# Altium project EITWatch.PrjPcb
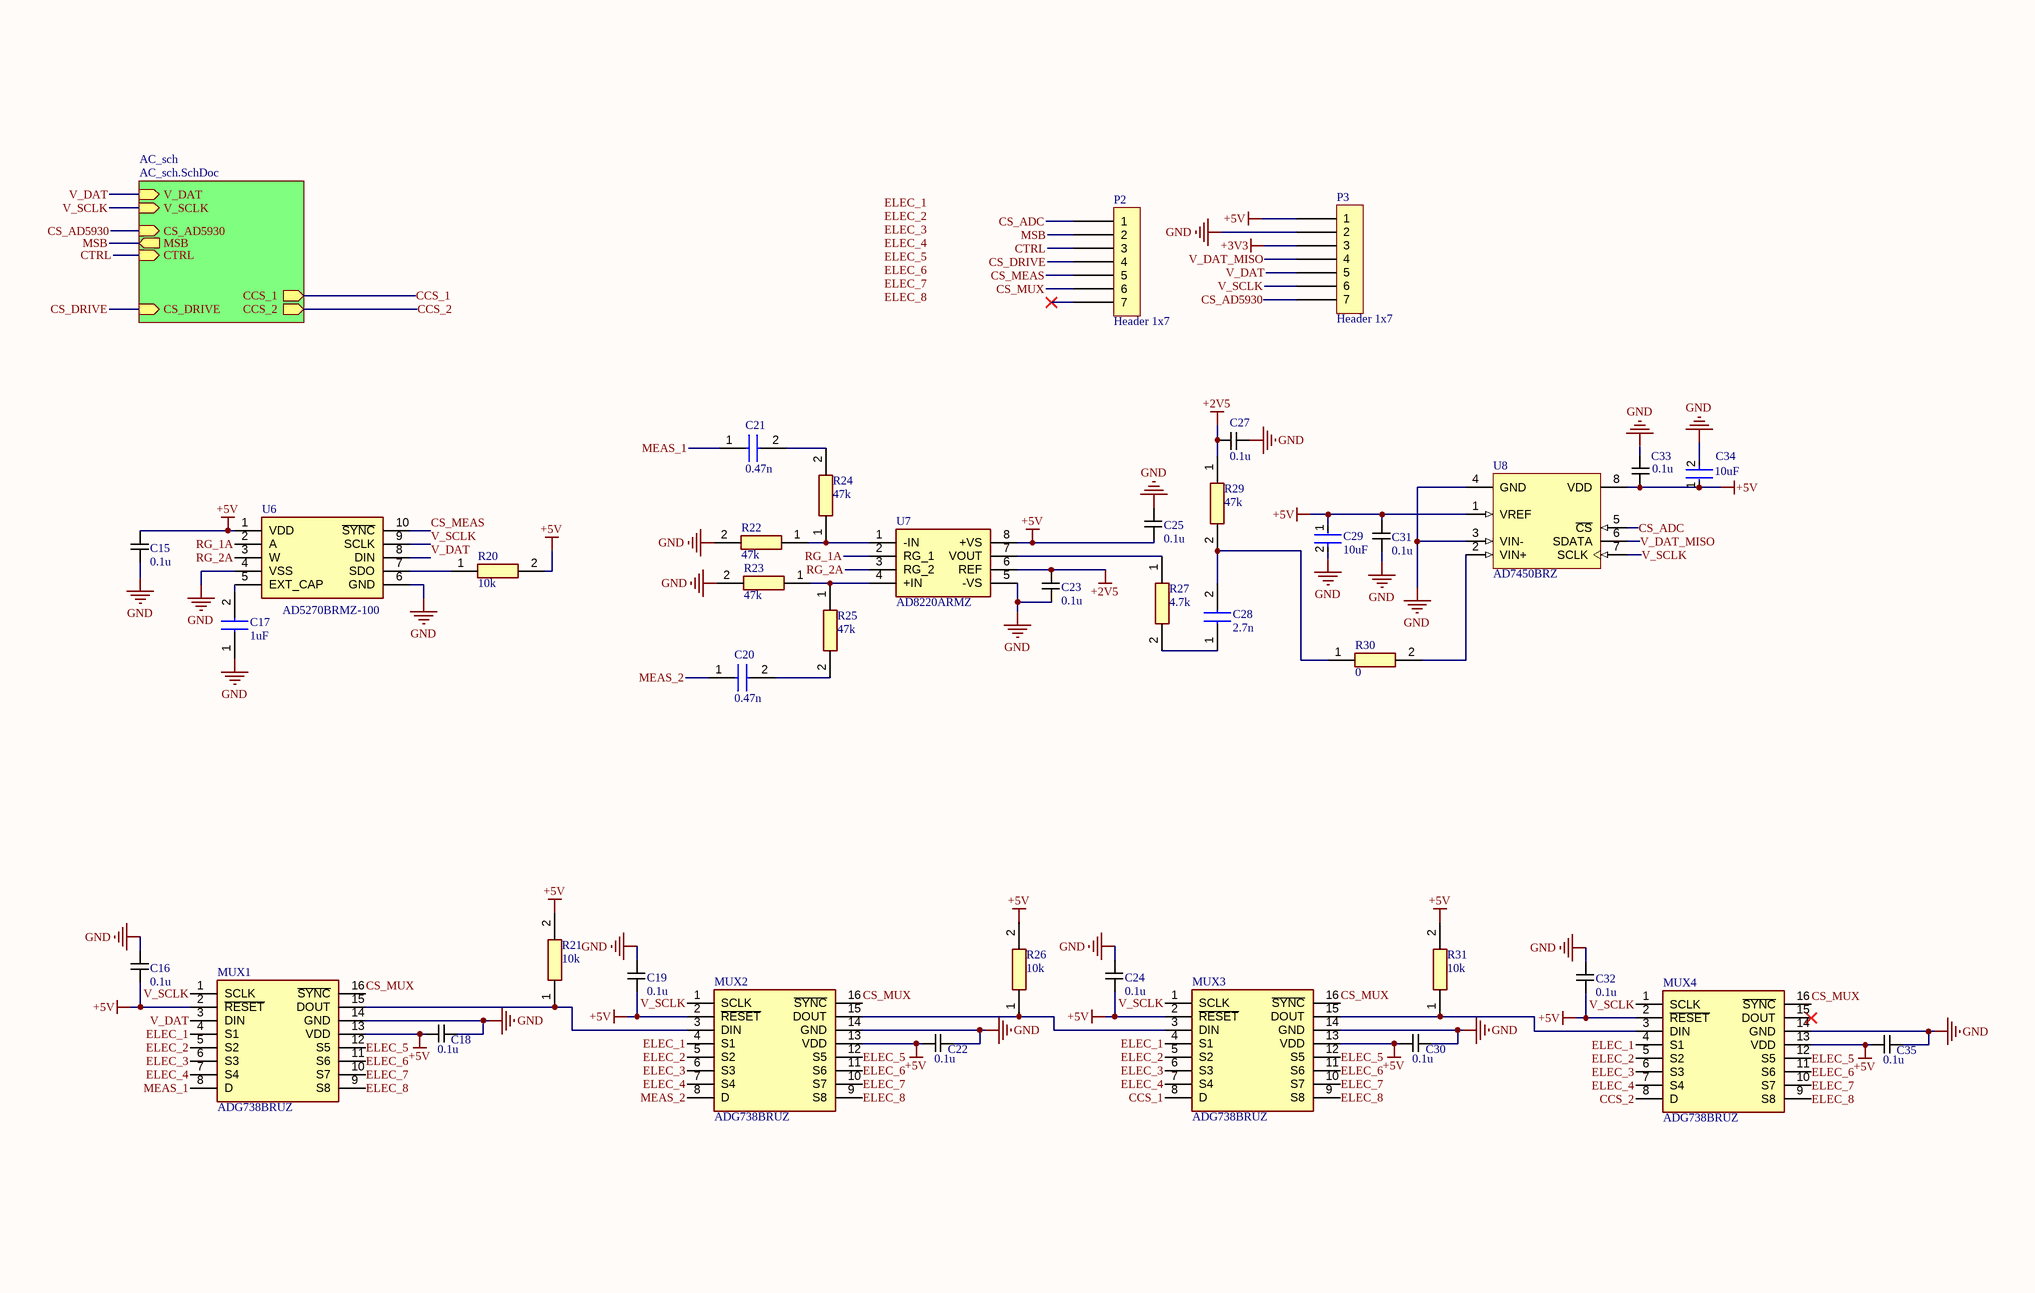
[diagram p0: main.SchDoc]
2 sheets, 77 parts. Net scope: hierarchical (ports join the sheet entries above them; power ports are global).
Board file: main.PcbDoc
Sheets:
  main.SchDoc
    AC_sch = AC_sch.SchDoc

## Sheet main.SchDoc
size B; Organization: ORGANIZATION; Address1: ADDRESS 1; Address2: ADDRESS 2; Address3: ADDRESS 3; Address4: ADDRESS 4; Revision: -; SheetNumber: 1; SheetTotal: 2; ENG_APP_DATE: --/--/--; DSN_APP_DATE: --/--/--; CHK_APP_DATE: --/--/--

### Parts
C15  0.1u  [CAPC1005X55N]
C16  0.1u  [CAPC1005X55N]
C17  1uF  [CAPC1005X55N]
C18  0.1u  [CAPC1005X55N]
C19  0.1u  [CAPC1005X55N]
C20  0.47n  [CAPC1005X70N]
C21  0.47n  [CAPC1005X70N]
C22  0.1u  [CAPC1005X55N]
C23  0.1u  [CAPC1005X55N]
C24  0.1u  [CAPC1005X55N]
C25  0.1u  [CAPC1005X55N]
C27  0.1u  [CAPC1005X55N]
C28  2.7n  [CAPC1608X90N]
C29  10uF  [FP-0402-L_1_0_1-W_0_5_0_1-MFG]
C30  0.1u  [CAPC1005X55N]
C31  0.1u  [CAPC1005X55N]
C32  0.1u  [CAPC1005X55N]
C33  0.1u  [CAPC1005X55N]
C34  10uF  [FP-0402-L_1_0_1-W_0_5_0_1-MFG]
C35  0.1u  [CAPC1005X55N]
MUX1  ADG738BRUZ  [SOP65P640X120-16N]
MUX2  ADG738BRUZ  [SOP65P640X120-16N]
MUX3  ADG738BRUZ  [SOP65P640X120-16N]
MUX4  ADG738BRUZ  [SOP65P640X120-16N]
P2  Header 1x7  [Header 1x7 male]
P3  Header 1x7  [Header 1x7 male]
R20  10k  [RESC1005X40N]
R21  10k  [RESC1005X40N]
R22  47k  [RESC1608X55N]
R23  47k  [RESC1608X55N]
R24  47k  [RESC1608X55N]
R25  47k  [RESC1608X55N]
R26  10k  [RESC1005X40N]
R27  4.7k  [RESC1608X55N]
R29  47k  [RESC1608X55N]
R30  0  [RESC2012X65N]
R31  10k  [RESC1005X40N]
U6  AD5270BRMZ-100  [SOP50P490X110-10N]
U7  AD8220ARMZ  [SOP65P490X110-8N]
U8  AD7450BRZ  [R-8_N]

### Sub-sheets
AC_sch = AC_sch.SchDoc: MSB (out), CTRL (in), V_DAT (in), V_SCLK (in), CS_AD5930 (in), CCS_1 (out), CCS_2 (out), CS_DRIVE (in)

### Nets
+2V5: C23.1 C27.1 R29.1 U7.6(REF)
+3V3: P3.3
+5V: C15.1 C16.2 C18.2 C19.2 C22.2 C24.2 C25.2 C29.1 C30.2 C31.1 C32.2 C33.2 C34.1 C35.2 MUX1.2(~{RESET}) MUX1.13(VDD) MUX2.2(~{RESET}) MUX2.13(VDD) MUX3.2(~{RESET}) MUX3.13(VDD) MUX4.2(~{RESET}) MUX4.13(VDD) P3.1 R20.2 R21.2 R26.2 R31.2 U6.1(VDD) U7.8(+VS) U8.1(VREF) U8.8(VDD)
GND: C15.2 C16.1 C17.1 C18.1 C19.1 C22.1 C23.2 C24.1 C25.1 C27.2 C29.2 C30.1 C31.2 C32.1 C33.1 C34.2 C35.1 MUX1.14(GND) MUX2.14(GND) MUX3.14(GND) MUX4.14(GND) P3.2 R22.2 R23.2 U6.4(VSS) U6.6(GND) U7.5(-VS) U8.3(VIN-) U8.4(GND)
CCS_1: MUX3.8(D) ; sheet AC_sch/CCS_1
CCS_2: MUX4.8(D) ; sheet AC_sch/CCS_2
CS_AD5930: P3.7 ; sheet AC_sch/CS_AD5930
CS_ADC: P2.1 U8.5(~{CS})
CS_DRIVE: P2.4 ; sheet AC_sch/CS_DRIVE
CS_MEAS: P2.5 U6.10(~{SYNC})
CS_MUX: MUX1.16(~{SYNC}) MUX2.16(~{SYNC}) MUX3.16(~{SYNC}) MUX4.16(~{SYNC}) P2.6
CTRL: P2.3 ; sheet AC_sch/CTRL
ELEC_1: MUX1.4(S1) MUX2.4(S1) MUX3.4(S1) MUX4.4(S1)
ELEC_2: MUX1.5(S2) MUX2.5(S2) MUX3.5(S2) MUX4.5(S2)
ELEC_3: MUX1.6(S3) MUX2.6(S3) MUX3.6(S3) MUX4.6(S3)
ELEC_4: MUX1.7(S4) MUX2.7(S4) MUX3.7(S4) MUX4.7(S4)
ELEC_5: MUX1.12(S5) MUX2.12(S5) MUX3.12(S5) MUX4.12(S5)
ELEC_6: MUX1.11(S6) MUX2.11(S6) MUX3.11(S6) MUX4.11(S6)
ELEC_7: MUX1.10(S7) MUX2.10(S7) MUX3.10(S7) MUX4.10(S7)
ELEC_8: MUX1.9(S8) MUX2.9(S8) MUX3.9(S8) MUX4.9(S8)
MEAS_1: C21.1 MUX1.8(D)
MEAS_2: C20.1 MUX2.8(D)
MSB: P2.2 ; sheet AC_sch/MSB
RG_1A: U6.2(A) U7.2(RG_1)
RG_2A: U6.3(W) U7.3(RG_2)
V_DAT: MUX1.3(DIN) P3.5 U6.8(DIN) ; sheet AC_sch/V_DAT
V_DAT_MISO: P3.4 U8.6(SDATA)
V_SCLK: MUX1.1(SCLK) MUX2.1(SCLK) MUX3.1(SCLK) MUX4.1(SCLK) P3.6 U6.9(SCLK) U8.7(SCLK) ; sheet AC_sch/V_SCLK
NetC17_2: C17.2 U6.5(EXT_CAP)
NetC20_2: C20.2 R25.2
NetC21_2: C21.2 R24.2
NetC28_1: C28.1 R27.2
NetC28_2: C28.2 R29.2 R30.1
NetMUX1_15: MUX1.15(DOUT) MUX2.3(DIN) R21.1
NetMUX2_15: MUX2.15(DOUT) MUX3.3(DIN) R26.1
NetMUX3_15: MUX3.15(DOUT) MUX4.3(DIN) R31.1
NetR20_1: R20.1 U6.7(SDO)
NetR22_1: R22.1 R24.1 U7.1(-IN)
NetR23_1: R23.1 R25.1 U7.4(+IN)
NetR27_1: R27.1 U7.7(VOUT)
NetR30_2: R30.2 U8.2(VIN+)

Not connected (* = marked no-connect by the designer): MUX4 15(DOUT)*; P2 7*

### Notes on the sheet
- Labels drawn without touching a wire or pin: ELEC_1, ELEC_2, ELEC_3, ELEC_4, ELEC_5, ELEC_6, ELEC_7, ELEC_8
- DWG. NO.
- REV.
- SHT.
- THIS DOCUMENT AND THE DATA DISCLOSED HEREIN OR HEREWITH IS THE PROPERTY OF ALTIUM LIMITED AND MAY BE FREELY DISTRIBUTED IN WHOLE. NO RIGHTS ARE RESERVED OR EXPRESS OR IMPLIED WARANTEE GIVEN.
- REVISION
- DESCRIPTION
- DATE
- APPROVED
- ENG:
- APPROVALS
- PROJECT
- DSN:
- CHK:
- REFERENCE DOCUMENTS
- PROJECT REVISION:
- TITLE
- DOCUMENT REVISION:
- DESIGN ITEM:
- BOM:
- FAB DWG:
- PCB DWG:
- ASSY DWG:
- SCALE:
- SIZE
- B
- CAGE CODE
- FILE NAME
- DWG NO.
- SHEET
- OF
- REV

### Library data of the parts
C15 C16 C18 C19 C22-C25 C27 C30-C33 C35 = CL05B104KO5NNNC: Capacitor; Manufacturer_Name: SAMSUNG; Datasheet Link: https://datasheet.datasheetarchive.com/originals/distributors/Datasheets-DGA10/2408147.pdf; Height: 0.55mm; Manufacturer_Part_Number: CL05B104KO5NNNC; Mouser Part Number: 187-CL05B104KO5NNNC; Mouser Price/Stock: https://www.mouser.co.uk/ProductDetail/Samsung-Electro-Mechanics/CL05B104KO5NNNC?qs=hqM3L16%252BxlfT2SKOuAUq6Q%3D%3D; Arrow Part Number: CL05B104KO5NNNC; Arrow Price/Stock: https://www.arrow.com/en/products/cl05b104ko5nnnc/samsung-electro-mechanics?utm_currency=USD&region=nac
C17 = CL05A105KP5NNNC: Capacitor; Manufacturer_Name: SAMSUNG; Datasheet Link: https://www.arrow.com/en/products/cl05a105kp5nnnc/samsung-electro-mechanics; Height: 0.55mm; Manufacturer_Part_Number: CL05A105KP5NNNC; Mouser Part Number: 187-CL05A105KP5NNNC; Mouser Price/Stock: https://www.mouser.co.uk/ProductDetail/Samsung-Electro-Mechanics/CL05A105KP5NNNC?qs=X6jEic%2FHinBsUeNeR9HD7w%3D%3D; Arrow Part Number: CL05A105KP5NNNC; Arrow Price/Stock: https://www.arrow.com/en/products/cl05a105kp5nnnc/samsung-electro-mechanics?region=nac
C20 C21 = GRM1555C1H431JA01D: Capacitor; Manufacturer_Name: Murata Electronics; Datasheet Link: https://search.murata.co.jp/Ceramy/image/img/A01X/G101/ENG/GRM1555C1H431JA01-01A.pdf; Height: 0.7mm; Manufacturer_Part_Number: GRM1555C1H431JA01D; Mouser Part Number: 81-GRM1555C1H431JA1D; Mouser Price/Stock: https://www.mouser.co.uk/ProductDetail/Murata-Electronics/GRM1555C1H431JA01D?qs=MY6wChARw2wtFsv3uU537Q%3D%3D
C28 = GRM1885C1H272JA01D: Capacitor; Manufacturer_Name: Murata Electronics; Datasheet Link: https://search.murata.co.jp/Ceramy/image/img/A01X/G101/ENG/GRM1885C1H272JA01-01A.pdf; Height: 0.9mm; Manufacturer_Part_Number: GRM1885C1H272JA01D; Mouser Part Number: 81-GRM185C1H272JA01D; Mouser Price/Stock: https://www.mouser.co.uk/ProductDetail/Murata-Electronics/GRM1885C1H272JA01D?qs=%2FEhSLMV8HUQlL5ZggNQk6g%3D%3D; Arrow Part Number: GRM1885C1H272JA01D; Arrow Price/Stock: https://www.arrow.com/en/products/grm1885c1h272ja01d/murata-manufacturing
C29 C34 = CMP-04427-000034-1: CAP CER 10UF 4V X5R 0402; RoHS Compliant: Yes
MUX1-MUX4 = ADG738BRUZ: Integrated Circuit; Manufacturer_Name: Analog Devices; Datasheet Link: http://www.analog.com/media/en/technical-documentation/data-sheets/ADG738_739.pdf; Height: 1.2mm; Manufacturer_Part_Number: ADG738BRUZ; Mouser Part Number: 584-ADG738BRUZ; Mouser Price/Stock: https://www.mouser.co.uk/ProductDetail/Analog-Devices/ADG738BRUZ?qs=BpaRKvA4VqFBoYY1IG1vMw%3D%3D; Arrow Part Number: ADG738BRUZ; Arrow Price/Stock: https://www.arrow.com/en/products/adg738bruz/analog-devices
R20 R21 R26 R31 = RC0402JR-0710KL: Resistor; Manufacturer_Name: YAGEO; Datasheet Link: https://www.yageo.com/upload/media/product/productsearch/datasheet/rchip/PYu-RC_Group_51_RoHS_L_12.pdf; Height: 0.4mm; Manufacturer_Part_Number: RC0402JR-0710KL; Mouser Part Number: 603-RC0402JR-0710KL; Mouser Price/Stock: https://www.mouser.co.uk/ProductDetail/YAGEO/RC0402JR-0710KL?qs=V1yeUXFNrkk4BhFptVo0Rw%3D%3D; Arrow Part Number: RC0402JR-0710KL; Arrow Price/Stock: https://www.arrow.com/en/products/rc0402jr-0710kl/yageo?region=nac
R22-R25 R29 = 0603WAF4702T5E: Resistor; Manufacturer_Name: UNI-ROYAL(Uniroyal Elec); Datasheet Link: https://datasheet.lcsc.com/szlcsc/Uniroyal-Elec-0603WAF4702T5E_C25819.pdf; Height: 0.55mm; Manufacturer_Part_Number: 0603WAF4702T5E
R27 = 0603WAF4701T5E: Resistor; Manufacturer_Name: UNI-ROYAL(Uniroyal Elec); Datasheet Link: https://datasheet.lcsc.com/szlcsc/Uniroyal-Elec-0603WAF4701T5E_C23162.pdf; Height: 0.55mm; Manufacturer_Part_Number: 0603WAF4701T5E
R30 = CPF0805B10RE1: Resistor; Manufacturer_Name: TE Connectivity; Datasheet Link: http://docs-europe.electrocomponents.com/webdocs/13d1/0900766b813d116f.pdf; Height: 0.65mm; Manufacturer_Part_Number: CPF0805B10RE1; Mouser Part Number: 279-CPF0805B10RE1; Mouser Price/Stock: https://www.mouser.co.uk/ProductDetail/TE-Connectivity-Holsworthy/CPF0805B10RE1?qs=qj6TO2nKJqjxTen6wABuaQ%3D%3D; Arrow Part Number: CPF0805B10RE1; Arrow Price/Stock: https://www.arrow.com/en/products/cpf0805b10re1/te-connectivity?region=nac
U6 = AD5270BRMZ-100: Integrated Circuit; Manufacturer_Name: Analog Devices; Datasheet Link: https://www.analog.com/media/en/technical-documentation/data-sheets/ad5270_5271.pdf; Height: 1.1mm; Manufacturer_Part_Number: AD5270BRMZ-100; Mouser Part Number: 584-AD5270BRMZ-100; Mouser Price/Stock: https://www.mouser.co.uk/ProductDetail/Analog-Devices/AD5270BRMZ-100?qs=NmRFExCfTkFpgTn7ufWp4w%3D%3D; Arrow Part Number: AD5270BRMZ-100; Arrow Price/Stock: https://www.arrow.com/en/products/ad5270brmz-100/analog-devices?region=europe
U7 = AD8220ARMZ: Integrated Circuit; Manufacturer_Name: Analog Devices; Datasheet Link: http://www.analog.com/static/imported-files/data_sheets/AD8220.pdf; Height: 1.1mm; Manufacturer_Part_Number: AD8220ARMZ; Mouser Part Number: 584-AD8220ARMZ; Mouser Price/Stock: https://www.mouser.co.uk/ProductDetail/Analog-Devices/AD8220ARMZ?qs=%2FtpEQrCGXCySRYIeTivM6A%3D%3D; Arrow Part Number: AD8220ARMZ; Arrow Price/Stock: https://www.arrow.com/en/products/ad8220armz/analog-devices?utm_currency=USD&region=europe
U8 = CMP-0313-01330-2: Single 12-Bit Analog-to-Digital Converter with Serial Interface, 1MSPS, -40 to +85 degC, R-8, Pb-Free, Tube; Manufacturer: Analog Devices; Generic Part Number: AD7450; Resolution (Bits): 12; Interface: Ser; Channels: 1; Throughput Rate (SPS): 1M; PackageReference: R-8; ComponentLink4URL: http://www.analog.com/en/analog-to-digital-converters/ad-converters/ad7450/products/product.html; ComponentLink2URL: http://www.analog.com/static/imported-files/data_sheets/AD7450.pdf; Mounting Technology: Surface Mount; DatasheetVersion: Rev.A; Code_JEDEC: MS-012-AA; PartNumber: AD7450BRZ; ComponentLink3URL: http://www.analog.com/static/imported-files/packages/PKG_PDF/SOIC_Narrow%20(R)/R_8.pdf; Packing: Tube; PackageDescription: 8-Lead Standard Small Outline Package [SOIC_N] Narrow Body; ComponentLink2Description: Datasheet; ComponentLink1URL: http://www.analog.com/en/index.html; ComponentLink3Description: Package Specification; ComponentLink1Description: Manufacturer URL; Code_IPC: SOIC127P600-8; PackageVersion: 060506-A; ComponentLink4Description: Product URL; RoHS: Y

## Sheet AC_sch.SchDoc
size A; Organization: ORGANIZATION; Address1: ADDRESS 1; Address2: ADDRESS 2; Address3: ADDRESS 3; Address4: ADDRESS 4; Revision: -; SheetNumber: 2; SheetTotal: 2; ENG_APP_DATE: --/--/--; DSN_APP_DATE: --/--/--; CHK_APP_DATE: --/--/--
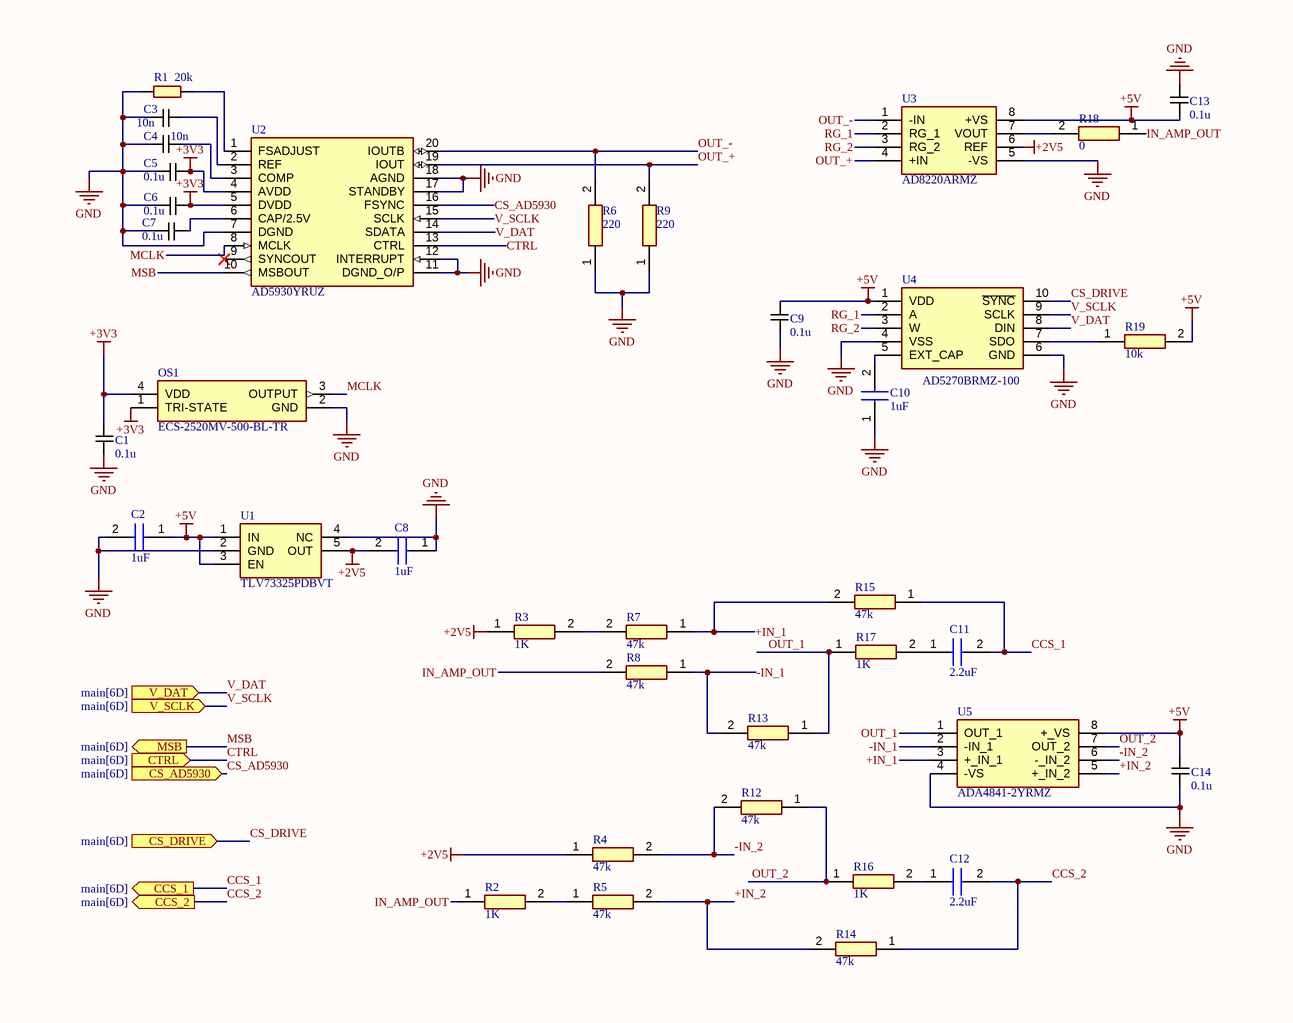
[diagram p1: AC_sch.SchDoc]

### Parts
C1  0.1u  [CAPC1005X55N]
C2  1uF  [CAPC1005X55N]
C3  10n  [CAPC1005X55N]
C4  10n  [CAPC1005X55N]
C5  0.1u  [CAPC1005X55N]
C6  0.1u  [CAPC1005X55N]
C7  0.1u  [CAPC1005X55N]
C8  1uF  [CAPC1005X55N]
C9  0.1u  [CAPC1005X55N]
C10  1uF  [CAPC1005X55N]
C11  2.2uF  [CAPC1005X57N]
C12  2.2uF  [CAPC1005X57N]
C13  0.1u  [CAPC1005X55N]
C14  0.1u  [CAPC1005X55N]
OS1  ECS-2520MV-500-BL-TR  [ECS2520MV500BLTR]
R1  20k  [RESC1005X40N]
R2  1K  [RESC1005X40N]
R3  1K  [RESC1005X40N]
R4  47k  [RESC1608X55N]
R5  47k  [RESC1608X55N]
R6  220  [RESC1005X40N]
R7  47k  [RESC1608X55N]
R8  47k  [RESC1608X55N]
R9  220  [RESC1005X40N]
R12  47k  [RESC1608X55N]
R13  47k  [RESC1608X55N]
R14  47k  [RESC1608X55N]
R15  47k  [RESC1608X55N]
R16  1K  [RESC1005X40N]
R17  1K  [RESC1005X40N]
R18  0  [RESC2012X65N]
R19  10k  [RESC1005X40N]
U1  TLV73325PDBVT  [SOT95P280X145-5N]
U2  AD5930YRUZ  [SOP65P640X120-20N]
U3  AD8220ARMZ  [SOP65P490X110-8N]
U4  AD5270BRMZ-100  [SOP50P490X110-10N]
U5  ADA4841-2YRMZ  [SOP65P490X110-8N]

### Ports
CCS_1 (out, see main[6D]), CCS_2 (out, see main[6D]), CS_AD5930 (in, see main[6D]), CS_DRIVE (in, see main[6D]), CTRL (in, see main[6D]), MSB (out, see main[6D]), V_DAT (in, see main[6D]), V_SCLK (in, see main[6D])

### Nets
+2V5: C8.2 R3.1 R4.1 U1.5(OUT) U3.6(REF)
+3V3: C1.2 C5.2 C6.2 OS1.1(TRI-STATE) OS1.4(VDD) U2.4(AVDD) U2.5(DVDD)
+5V: C2.1 C9.1 C13.2 C14.2 R19.2 U1.1(IN) U1.3(EN) U3.8(+VS) U4.1(VDD) U5.8(+_VS)
GND: C1.1 C2.2 C3.1 C4.2 C5.1 C6.1 C7.1 C8.1 C9.2 C10.1 C13.1 C14.1 OS1.2(GND) R1.1 R6.1 R9.1 U1.2(GND) U1.4(NC) U2.7(DGND) U2.11(DGND_O/P) U2.12(INTERRUPT) U2.17(STANDBY) U2.18(AGND) U3.5(-VS) U4.4(VSS) U4.6(GND) U5.4(-VS)
+IN_1: R7.1 R15.2 U5.3(+_IN_1)
+IN_2: R5.2 R14.2 U5.5(+_IN_2)
-IN_1: R8.1 R13.2 U5.2(-IN_1)
-IN_2: R4.2 R12.2 U5.6(-_IN_2)
CCS_1: C11.2 R15.1 ; port CCS_1
CCS_2: C12.2 R14.1 ; port CCS_2
CS_AD5930: U2.16(FSYNC) ; port CS_AD5930
CS_DRIVE: U4.10(~{SYNC}) ; port CS_DRIVE
CTRL: U2.13(CTRL) ; port CTRL
IN_AMP_OUT: R2.1 R8.2 R18.1
MCLK: OS1.3(OUTPUT) U2.8(MCLK)
MSB: U2.10(MSBOUT) ; port MSB
OUT_1: R13.1 R17.1 U5.1(OUT_1)
OUT_2: R12.1 R16.1 U5.7(OUT_2)
OUT_+: R9.2 U2.19(IOUT) U3.4(+IN)
OUT_-: R6.2 U2.20(IOUTB) U3.1(-IN)
RG_1: U3.2(RG_1) U4.2(A)
RG_2: U3.3(RG_2) U4.3(W)
V_DAT: U2.14(SDATA) U4.8(DIN) ; port V_DAT
V_SCLK: U2.15(SCLK) U4.9(SCLK) ; port V_SCLK
NetC3_2: C3.2 U2.2(REF)
NetC4_1: C4.1 U2.3(COMP)
NetC7_2: C7.2 U2.6(CAP/2.5V)
NetC10_2: C10.2 U4.5(EXT_CAP)
NetC11_1: C11.1 R17.2
NetC12_1: C12.1 R16.2
NetR1_2: R1.2 U2.1(FSADJUST)
NetR2_2: R2.2 R5.1
NetR3_2: R3.2 R7.2
NetR18_2: R18.2 U3.7(VOUT)
NetR19_1: R19.1 U4.7(SDO)

Not connected (* = marked no-connect by the designer): U2 9(SYNCOUT)*

### Notes on the sheet
- DWG. NO.
- REV.
- SHT.
- THIS DOCUMENT AND THE DATA DISCLOSED HEREIN OR HEREWITH IS THE PROPERTY OF ALTIUM LIMITED AND MAY BE FREELY DISTRIBUTED IN WHOLE. NO RIGHTS ARE RESERVED OR EXPRESS OR IMPLIED WARANTEE GIVEN.
- REVISION
- DESCRIPTION
- DATE
- APPROVED
- ENG:
- APPROVALS
- PROJECT
- DSN:
- CHK:
- REFERENCE DOCUMENTS
- PROJECT REVISION:
- TITLE
- DOCUMENT REVISION:
- DESIGN ITEM:
- BOM:
- FAB DWG:
- PCB DWG:
- ASSY DWG:
- SCALE:
- SIZE
- B
- CAGE CODE
- FILE NAME
- DWG NO.
- SHEET
- OF
- REV

### Library data of the parts
C1 C5-C7 C9 C13 C14 = CL05B104KO5NNNC: Capacitor; Manufacturer_Name: SAMSUNG; Datasheet Link: https://datasheet.datasheetarchive.com/originals/distributors/Datasheets-DGA10/2408147.pdf; Height: 0.55mm; Manufacturer_Part_Number: CL05B104KO5NNNC; Mouser Part Number: 187-CL05B104KO5NNNC; Mouser Price/Stock: https://www.mouser.co.uk/ProductDetail/Samsung-Electro-Mechanics/CL05B104KO5NNNC?qs=hqM3L16%252BxlfT2SKOuAUq6Q%3D%3D; Arrow Part Number: CL05B104KO5NNNC; Arrow Price/Stock: https://www.arrow.com/en/products/cl05b104ko5nnnc/samsung-electro-mechanics?utm_currency=USD&region=nac
C2 C8 C10 = CL05A105KP5NNNC: Capacitor; Manufacturer_Name: SAMSUNG; Datasheet Link: https://www.arrow.com/en/products/cl05a105kp5nnnc/samsung-electro-mechanics; Height: 0.55mm; Manufacturer_Part_Number: CL05A105KP5NNNC; Mouser Part Number: 187-CL05A105KP5NNNC; Mouser Price/Stock: https://www.mouser.co.uk/ProductDetail/Samsung-Electro-Mechanics/CL05A105KP5NNNC?qs=X6jEic%2FHinBsUeNeR9HD7w%3D%3D; Arrow Part Number: CL05A105KP5NNNC; Arrow Price/Stock: https://www.arrow.com/en/products/cl05a105kp5nnnc/samsung-electro-mechanics?region=nac
C3 C4 = CL05B103KB5NNNC: Capacitor; Manufacturer_Name: SAMSUNG; Datasheet Link: https://datasheet.datasheetarchive.com/originals/distributors/Datasheets-DGA10/2407958.pdf; Height: 0.55mm; Manufacturer_Part_Number: CL05B103KB5NNNC; Mouser Part Number: 187-CL05B103KB5NNNC; Mouser Price/Stock: https://www.mouser.co.uk/ProductDetail/Samsung-Electro-Mechanics/CL05B103KB5NNNC?qs=349EhDEZ59pcaIbMQHo3bQ%3D%3D; Arrow Part Number: CL05B103KB5NNNC; Arrow Price/Stock: https://www.arrow.com/en/products/cl05b103kb5nnnc/samsung-electro-mechanics?utm_currency=USD&region=nac
C11 C12 = CL05A225MQ5NSNC: Capacitor; Manufacturer_Name: SAMSUNG; Datasheet Link: https://datasheet.datasheetarchive.com/originals/dk/DKDS-19/372932.pdf; Height: 0.57mm; Manufacturer_Part_Number: CL05A225MQ5NSNC; Mouser Part Number: 187-CL05A225MQ5NSNC; Mouser Price/Stock: https://www.mouser.co.uk/ProductDetail/Samsung-Electro-Mechanics/CL05A225MQ5NSNC?qs=X6jEic%2FHinC0eBcvtpjFyQ%3D%3D; Arrow Part Number: CL05A225MQ5NSNC; Arrow Price/Stock: https://www.arrow.com/en/products/cl05a225mq5nsnc/samsung-electro-mechanics?utm_currency=USD&region=nac
OS1 = ECS-2520MV-500-BL-TR: Crystal or Oscillator; Manufacturer_Name: ECS; Datasheet Link: https://ecsxtal.com/store/pdf/ECS-2520MV.pdf; Height: 0.9mm; Manufacturer_Part_Number: ECS-2520MV-500-BL-TR; Mouser Part Number: 520-2520MV-500-BL-TR; Mouser Price/Stock: https://www.mouser.co.uk/ProductDetail/ECS/ECS-2520MV-500-BL-TR?qs=DRkmTr78QARre2%252BXmq63mg%3D%3D; Arrow Part Number: ECS-2520MV-500-BL-TR; Arrow Price/Stock: https://www.arrow.com/en/products/ecs-2520mv-500-bl-tr/ecs-international?region=nac
R1 = RC0402FR0720KL: Resistor; Manufacturer_Name: KEMET; Datasheet Link: http://www.yageo.com/documents/recent/PYu-RC0402_51_RoHS_L_6_r.pdf; Height: 0.4mm; Manufacturer_Part_Number: RC0402FR0720KL; Arrow Part Number: RC0402FR0720KL; Arrow Price/Stock: https://www.arrow.com/en/products/rc0402fr-0720kl/yageo
R2 R3 R16 R17 = 0402WGF1001TCE: Resistor; Manufacturer_Name: UNI-ROYAL(Uniroyal Elec); Datasheet Link: https://datasheet.lcsc.com/szlcsc/Uniroyal-Elec-0402WGF1001TCE_C11702.pdf; Height: 0.4mm; Manufacturer_Part_Number: 0402WGF1001TCE
R4 R5 R7 R8 R12-R15 = 0603WAF4702T5E: as R22 on sheet main; Datasheet Link: https://datasheet.lcsc.com/szlcsc/Uniroyal-Elec-0603WAF4702T5E_C25819.pdf; Height: 0.55mm; Manufacturer_Part_Number: 0603WAF4702T5E
R6 R9 = 0402WGF2200TCE: Resistor; Manufacturer_Name: ROYALOHM; Datasheet Link: https://www2.mouser.com/datasheet/2/1365/1-3044649.pdf; Height: 0.4mm; Manufacturer_Part_Number: 0402WGF2200TCE; Mouser Part Number: 303-0402WGF2200TCE; Mouser Price/Stock: https://www.mouser.co.uk/ProductDetail/Royalohm/0402WGF2200TCE?qs=e8oIoAS2J1RP9vRYNvZ%252BDQ%3D%3D
R18 = CPF0805B10RE1: as R30 on sheet main; Datasheet Link: http://docs-europe.electrocomponents.com/webdocs/13d1/0900766b813d116f.pdf; Height: 0.65mm; Manufacturer_Part_Number: CPF0805B10RE1; Mouser Part Number: 279-CPF0805B10RE1; Mouser Price/Stock: https://www.mouser.co.uk/ProductDetail/TE-Connectivity-Holsworthy/CPF0805B10RE1?qs=qj6TO2nKJqjxTen6wABuaQ%3D%3D; Arrow Part Number: CPF0805B10RE1; Arrow Price/Stock: https://www.arrow.com/en/products/cpf0805b10re1/te-connectivity?region=nac
R19 = RC0402JR-0710KL: Resistor; Manufacturer_Name: YAGEO; Datasheet Link: https://www.yageo.com/upload/media/product/productsearch/datasheet/rchip/PYu-RC_Group_51_RoHS_L_12.pdf; Height: 0.4mm; Manufacturer_Part_Number: RC0402JR-0710KL; Mouser Part Number: 603-RC0402JR-0710KL; Mouser Price/Stock: https://www.mouser.co.uk/ProductDetail/YAGEO/RC0402JR-0710KL?qs=V1yeUXFNrkk4BhFptVo0Rw%3D%3D; Arrow Part Number: RC0402JR-0710KL; Arrow Price/Stock: https://www.arrow.com/en/products/rc0402jr-0710kl/yageo?region=nac
U1 = TLV73325PDBVT: Integrated Circuit; Manufacturer_Name: Texas Instruments; Datasheet Link: http://www.ti.com/lit/gpn/TLV733P; Height: 1.45mm; Manufacturer_Part_Number: TLV73325PDBVT; Mouser Part Number: 595-TLV73325PDBVT; Mouser Price/Stock: https://www.mouser.co.uk/ProductDetail/Texas-Instruments/TLV73325PDBVT?qs=ifm8N2KdrcboKl2OgYRRdw%3D%3D; Arrow Part Number: TLV73325PDBVT; Arrow Price/Stock: https://www.arrow.com/en/products/tlv73325pdbvt/texas-instruments
U2 = AD5930YRUZ: Integrated Circuit; Manufacturer_Name: Analog Devices; Datasheet Link: https://datasheet.datasheetarchive.com/originals/distributors/Datasheets-4/DSA-67194.pdf; Height: 1.2mm; Manufacturer_Part_Number: AD5930YRUZ; Mouser Part Number: 584-AD5930YRUZ; Mouser Price/Stock: https://www.mouser.co.uk/ProductDetail/Analog-Devices/AD5930YRUZ?qs=NmRFExCfTkFA5qWdGRGhzQ%3D%3D; Arrow Part Number: AD5930YRUZ; Arrow Price/Stock: https://www.arrow.com/en/products/ad5930yruz/analog-devices?region=nac
U3 = AD8220ARMZ: as U7 on sheet main; Datasheet Link: http://www.analog.com/static/imported-files/data_sheets/AD8220.pdf; Height: 1.1mm; Manufacturer_Part_Number: AD8220ARMZ; Mouser Part Number: 584-AD8220ARMZ; Mouser Price/Stock: https://www.mouser.co.uk/ProductDetail/Analog-Devices/AD8220ARMZ?qs=%2FtpEQrCGXCySRYIeTivM6A%3D%3D; Arrow Part Number: AD8220ARMZ; Arrow Price/Stock: https://www.arrow.com/en/products/ad8220armz/analog-devices?utm_currency=USD&region=europe
U4 = AD5270BRMZ-100: as U6 on sheet main; Datasheet Link: https://www.analog.com/media/en/technical-documentation/data-sheets/ad5270_5271.pdf; Height: 1.1mm; Manufacturer_Part_Number: AD5270BRMZ-100; Mouser Part Number: 584-AD5270BRMZ-100; Mouser Price/Stock: https://www.mouser.co.uk/ProductDetail/Analog-Devices/AD5270BRMZ-100?qs=NmRFExCfTkFpgTn7ufWp4w%3D%3D; Arrow Part Number: AD5270BRMZ-100; Arrow Price/Stock: https://www.arrow.com/en/products/ad5270brmz-100/analog-devices?region=europe
U5 = ADA4841-2YRMZ: Integrated Circuit; Manufacturer_Name: Analog Devices; Datasheet Link: https://datasheet.datasheetarchive.com/originals/distributors/Datasheets-SFU1/DSASFU10004447.pdf; Height: 1.1mm; Manufacturer_Part_Number: ADA4841-2YRMZ; Mouser Part Number: 584-ADA4841-2YRMZ; Mouser Price/Stock: https://www.mouser.co.uk/ProductDetail/Analog-Devices/ADA4841-2YRMZ?qs=BpaRKvA4VqEiAK4J4giIjQ%3D%3D; Arrow Part Number: ADA4841-2YRMZ; Arrow Price/Stock: https://www.arrow.com/en/products/ada4841-2yrmz/analog-devices?utm_currency=USD&region=nac

## Nets that join several sheets
+2V5: main (C23.1 C27.1 R29.1 U7.6), AC_sch (5 pins)
+3V3: main (P3.3), AC_sch (7 pins)
+5V: main (31 pins), AC_sch (10 pins)
GND: main (29 pins), AC_sch (27 pins)
CCS_1: main (MUX3.8), AC_sch (C11.2 R15.1)
CCS_2: main (MUX4.8), AC_sch (C12.2 R14.1)
CS_AD5930: main (P3.7), AC_sch (U2.16)
CS_DRIVE: main (P2.4), AC_sch (U4.10)
CTRL: main (P2.3), AC_sch (U2.13)
MSB: main (P2.2), AC_sch (U2.10)
V_DAT: main (MUX1.3 P3.5 U6.8), AC_sch (U2.14 U4.8)
V_SCLK: main (7 pins), AC_sch (U2.15 U4.9)